# Altium schematic sheet 07 - MCU.SchDoc
size A3; SheetNumber: 5; SheetTotal: 7
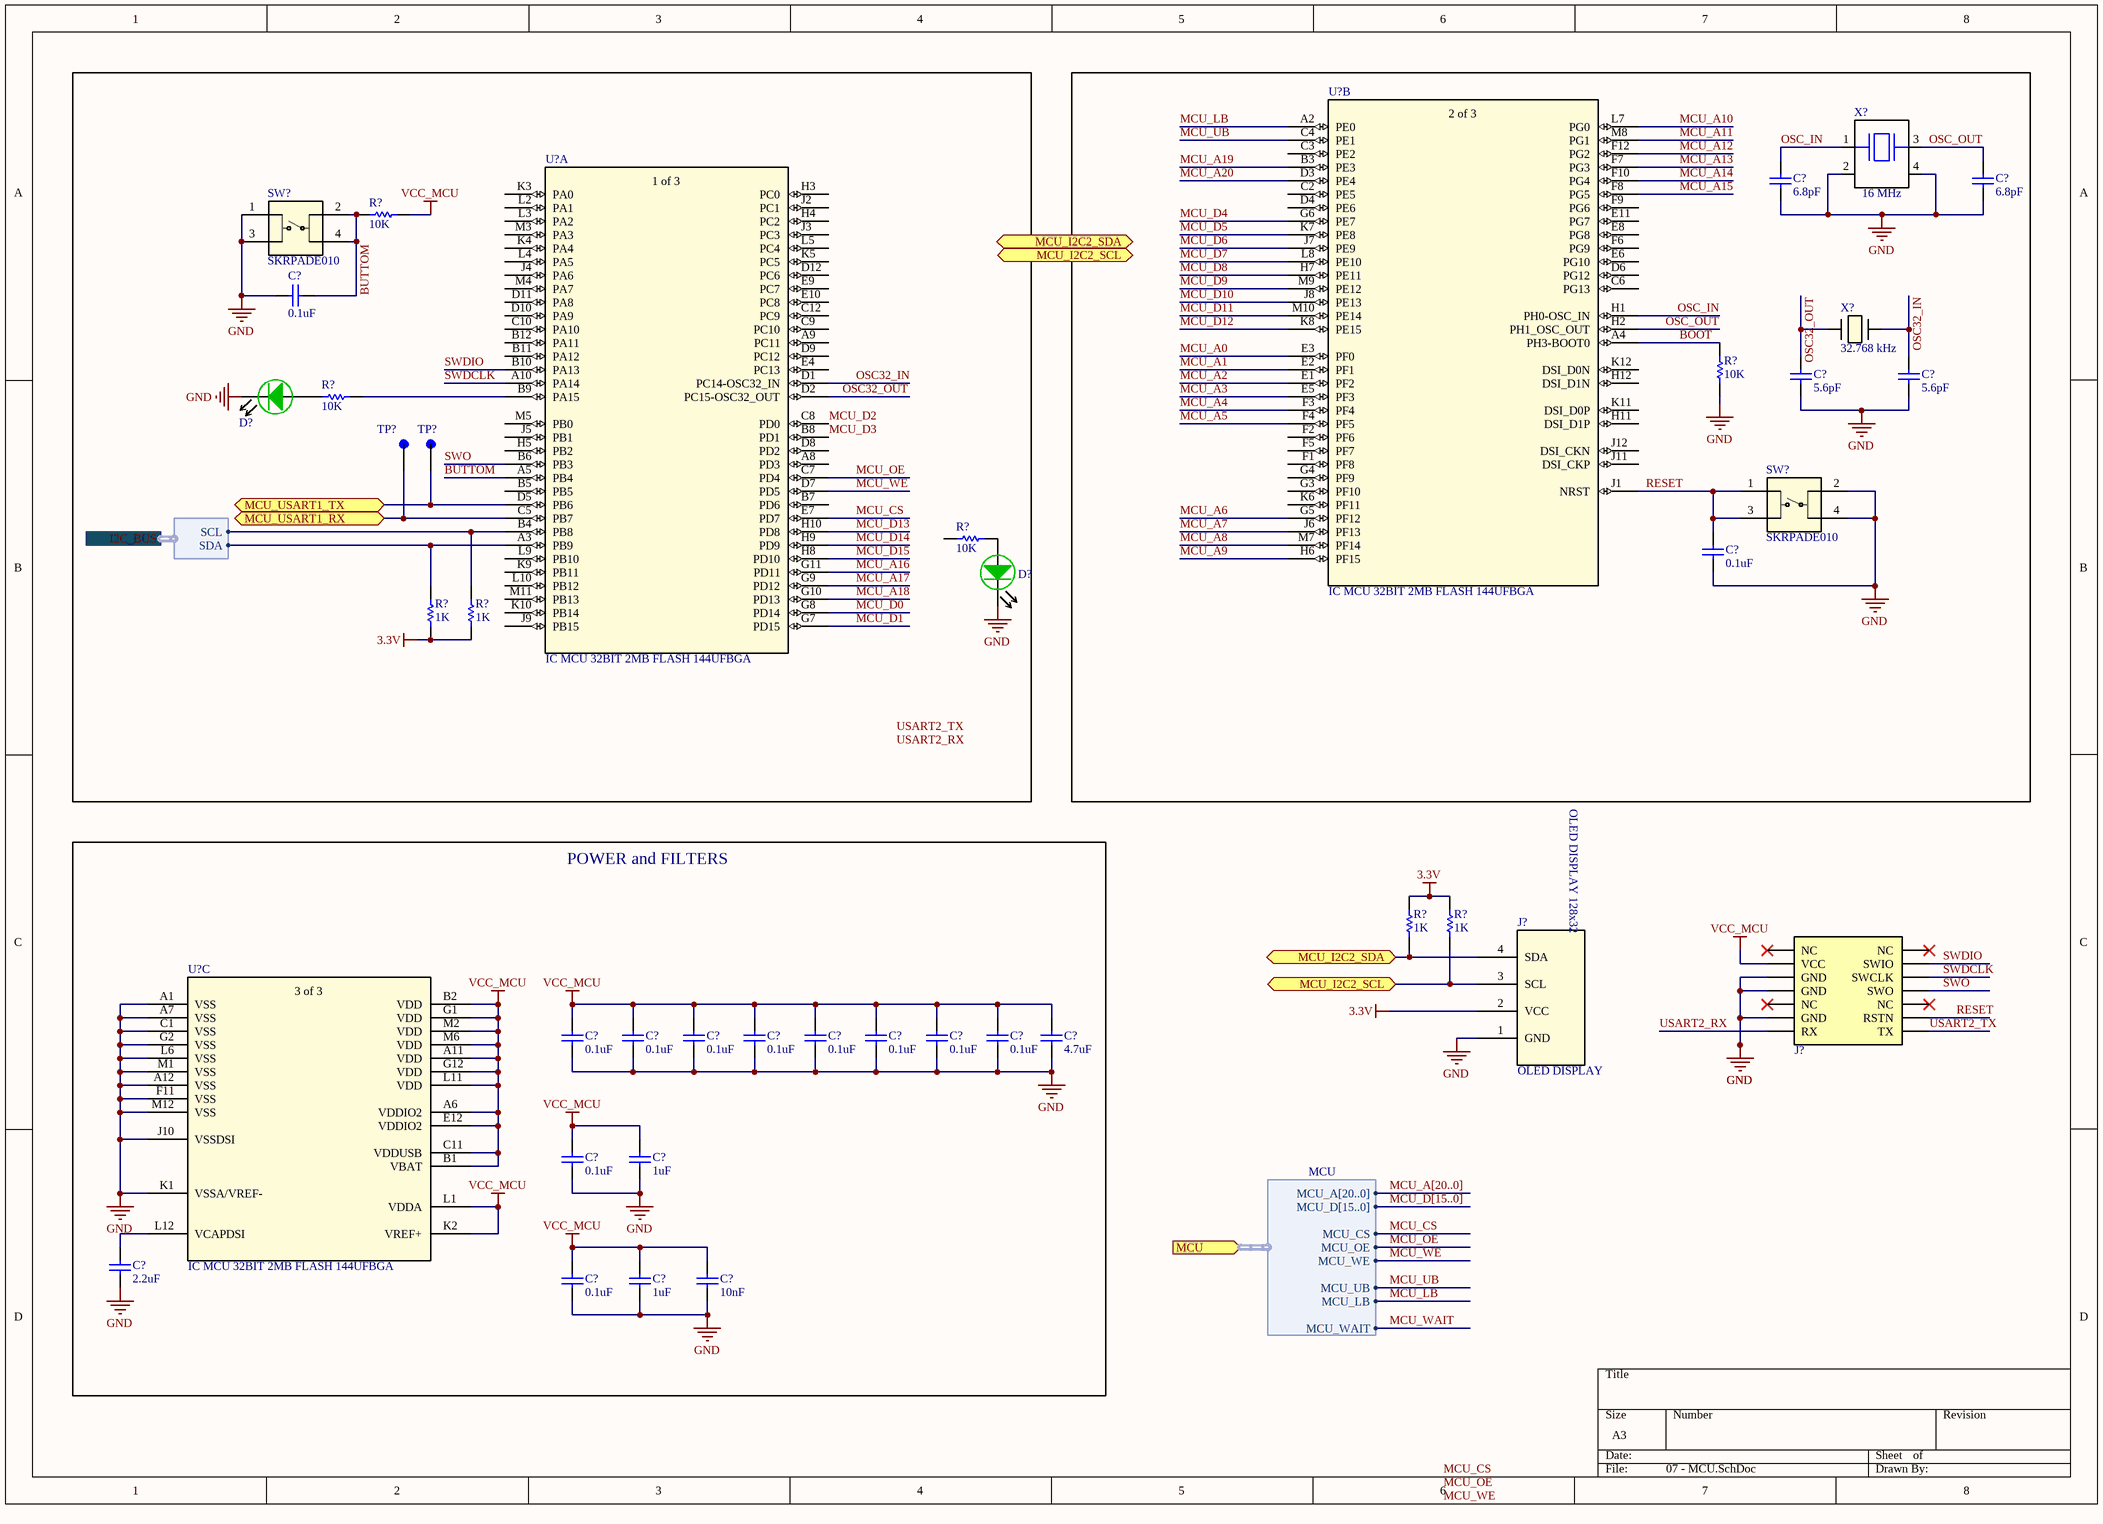
[diagram p0: 07 - MCU.SchDoc]

## Parts
(Parts that share a designator on the sheet are numbered #1, #2 ... from top to bottom, then left to right.)
C?#1  value 6.8pF  [0402-C-R]  (hidden comment: GRM0225C1E6R8CA03L)
C?#2  value 6.8pF  [0402-C-R]  (hidden comment: GRM0225C1E6R8CA03L)
C?#3  value 0.1uF  [0402-C-R]  (hidden comment: GRM155R61E104KA87D)
C?#4  value 5.6pF  [0402-C-R]  (hidden comment: CC0402BRNPO9BN5R6)
C?#5  value 5.6pF  [0402-C-R]  (hidden comment: CC0402BRNPO9BN5R6)
C?#6  value 0.1uF  [0402-C-R]  (hidden comment: GRM155R61E104KA87D)
C?#7  value 0.1uF  [0402-C-R]  (hidden comment: GRM155R61E104KA87D)
C?#8  value 0.1uF  [0402-C-R]  (hidden comment: GRM155R61E104KA87D)
C?#9  value 0.1uF  [0402-C-R]  (hidden comment: GRM155R61E104KA87D)
C?#10  value 0.1uF  [0402-C-R]  (hidden comment: GRM155R61E104KA87D)
C?#11  value 0.1uF  [0402-C-R]  (hidden comment: GRM155R61E104KA87D)
C?#12  value 0.1uF  [0402-C-R]  (hidden comment: GRM155R61E104KA87D)
C?#13  value 0.1uF  [0402-C-R]  (hidden comment: GRM155R61E104KA87D)
C?#14  value 0.1uF  [0402-C-R]  (hidden comment: GRM155R61E104KA87D)
C?#15  value 4.7uF  [0402-C-R]  (hidden comment: GRM155D81C475ME15J)
C?#16  value 0.1uF  [0402-C-R]  (hidden comment: GRM155R61E104KA87D)
C?#17  value 1uF  [0402-C-R]  (hidden comment: JMK105BJ105KV-F)
C?#18  value 2.2uF  [0402-C-R]  (hidden comment: 885012105013)
C?#19  value 0.1uF  [0402-C-R]  (hidden comment: GRM155R61E104KA87D)
C?#20  value 1uF  [0402-C-R]  (hidden comment: JMK105BJ105KV-F)
C?#21  value 10nF  [0402-C-R]  (hidden comment: KGM05AR71E103KH)
D?#1  150060GS75000  [LED0603]  (value not drawn)
D?#2  150060GS75000  [LED0603]  (value not drawn)
J?#1  CONN HEADER SMD 14POS 1.27MM_1  [SAMTEC_FTSH-107-01-L-DV-K-A]  (value not drawn)
J?#2  OLED DISPLAY  [OLED_DISPLAY]
R?#1  value 10K  [0402-R-R]  (hidden comment: RC0402FR-07560RL)
R?#2  value 10K  [0402-R-R]  (hidden comment: RC0402FR-07560RL)
R?#3  value 10K  [0402-R-R]  (hidden comment: RC0402FR-0710KL)
R?#4  value 10K  [0402-R-R]  (hidden comment: RC0402FR-0710KL)
R?#5  value 1K  [0402-R-R]  (hidden comment: RC0402FR-071KL)
R?#6  value 1K  [0402-R-R]  (hidden comment: RC0402FR-071KL)
R?#7  value 1K  [0402-R-R]  (hidden comment: RC0402FR-071KL)
R?#8  value 1K  [0402-R-R]  (hidden comment: RC0402FR-071KL)
SW?#1  SKRPADE010  [SKRPADE010_AAL]
SW?#2  SKRPADE010  [SKRPADE010_AAL]
TP?#1  5001  [TEST_POINT]  (value not drawn)
TP?#2  5001  [TEST_POINT]  (value not drawn)
U?#1  IC MCU 32BIT 2MB FLASH 144UFBGA  [UFBGA144-10x10mm]  (part B of 3)
U?#2  IC MCU 32BIT 2MB FLASH 144UFBGA  [UFBGA144-10x10mm]  (part A of 3)
U?#3  IC MCU 32BIT 2MB FLASH 144UFBGA  [UFBGA144-10x10mm]  (part C of 3)
X?#1  value 16 MHz  [XTAL_ECS-160-8-33Q-JES-TR]  (hidden comment: STDCRG1-16M)
X?#2  value 32.768 kHz  [XTAL_NX3215SA_NDK-M - duplicate]  (hidden comment: STDMUA14-32.768K)

## Blocks framed on the sheet
POWER and FILTERS: C?#7-C?#21 U?#3

## Ports
I2C_BUS (harness I2C), MCU (in, harness MCU), MCU_I2C2_SCL (bidir), MCU_I2C2_SDA (bidir), MCU_USART1_RX (bidir), MCU_USART1_TX (bidir)

## Harnesses
I2C: SCL, SDA
MCU: MCU_A[20..0], MCU_D[15..0], MCU_OE, MCU_WE, MCU_CS, MCU_UB, MCU_LB, MCU_WAIT

## Nets
3.3V: J?#2.2(VCC) R?#5.2 R?#6.2 R?#7.2 R?#8.2
GND: C?#1.2 C?#2.1 C?#3.2 C?#4.2 C?#5.2 C?#6.1 C?#7.1 C?#8.1 C?#9.1 C?#10.1 C?#11.1 C?#12.1 C?#13.1 C?#14.1 C?#15.1 C?#16.1 C?#17.1 C?#18.1 C?#19.1 C?#20.1 C?#21.1 D?#1.1(K) D?#2.1(K) J?#1.05(GND) J?#1.07(GND) J?#1.11(GND) J?#2.1(GND) R?#3.1 SW?#1.1 SW?#1.3 SW?#2.2 SW?#2.4 U?#3.A1(VSS) U?#3.A7(VSS) U?#3.A12(VSS) U?#3.C1(VSS) U?#3.F11(VSS) U?#3.G2(VSS) U?#3.J10(VSSDSI) U?#3.K1(VSSA/VREF-) U?#3.L6(VSS) U?#3.M1(VSS) U?#3.M12(VSS) X?#1.2(GND) X?#1.4(GND)
VCC_MCU: C?#7.2 C?#8.2 C?#9.2 C?#10.2 C?#11.2 C?#12.2 C?#13.2 C?#14.2 C?#15.2 C?#16.2 C?#17.2 C?#19.2 C?#20.2 C?#21.2 J?#1.03(VCC) R?#1.1 U?#3.A6(VDDIO2) U?#3.A11(VDD) U?#3.B1(VBAT) U?#3.B2(VDD) U?#3.C11(VDDUSB) U?#3.E12(VDDIO2) U?#3.G1(VDD) U?#3.G12(VDD) U?#3.K2(VREF+) U?#3.L1(VDDA) U?#3.L11(VDD) U?#3.M2(VDD) U?#3.M6(VDD)
BOOT: R?#3.2 U?#1.A4(PH3-BOOT0)
BUTTOM: C?#3.1 R?#1.2 SW?#1.2 SW?#1.4 U?#2.A5(PB4)
MCU_A0: U?#1.E3(PF0)
MCU_A1: U?#1.E2(PF1)
MCU_A2: U?#1.E1(PF2)
MCU_A3: U?#1.E5(PF3)
MCU_A4: U?#1.F3(PF4)
MCU_A5: U?#1.F4(PF5)
MCU_A6: U?#1.G5(PF12)
MCU_A7: U?#1.J6(PF13)
MCU_A8: U?#1.M7(PF14)
MCU_A9: U?#1.H6(PF15)
MCU_A10: U?#1.L7(PG0)
MCU_A11: U?#1.M8(PG1)
MCU_A12: U?#1.F12(PG2)
MCU_A13: U?#1.F7(PG3)
MCU_A14: U?#1.F10(PG4)
MCU_A15: U?#1.F8(PG5)
MCU_A16: U?#2.G11(PD11)
MCU_A17: U?#2.G9(PD12)
MCU_A18: U?#2.G10(PD13)
MCU_A19: U?#1.B3(PE3)
MCU_A20: U?#1.D3(PE4)
MCU_CS: U?#2.E7(PD7) ; port MCU.MCU_CS
MCU_D0: U?#2.G8(PD14)
MCU_D1: U?#2.G7(PD15)
MCU_D2: U?#2.C8(PD0)
MCU_D3: U?#2.B8(PD1)
MCU_D4: U?#1.G6(PE7)
MCU_D5: U?#1.K7(PE8)
MCU_D6: U?#1.J7(PE9)
MCU_D7: U?#1.L8(PE10)
MCU_D8: U?#1.H7(PE11)
MCU_D9: U?#1.M9(PE12)
MCU_D10: U?#1.J8(PE13)
MCU_D11: U?#1.M10(PE14)
MCU_D12: U?#1.K8(PE15)
MCU_D13: U?#2.H10(PD8)
MCU_D14: U?#2.H9(PD9)
MCU_D15: U?#2.H8(PD10)
MCU_I2C2_SCL: J?#2.3(SCL) R?#8.1 ; port MCU_I2C2_SCL
MCU_I2C2_SDA: J?#2.4(SDA) R?#7.1 ; port MCU_I2C2_SDA
MCU_LB: U?#1.A2(PE0) ; port MCU.MCU_LB
MCU_OE: U?#2.C7(PD4) ; port MCU.MCU_OE
MCU_UB: U?#1.C4(PE1) ; port MCU.MCU_UB
MCU_USART1_RX: TP?#1.1 U?#2.C5(PB7) ; port MCU_USART1_RX
MCU_USART1_TX: TP?#2.1 U?#2.D5(PB6) ; port MCU_USART1_TX
MCU_WAIT: port MCU.MCU_WAIT
MCU_WE: U?#2.D7(PD5) ; port MCU.MCU_WE
OSC32_IN: C?#5.1 U?#2.D1(PC14-OSC32_IN) X?#2.2
OSC32_OUT: C?#4.1 U?#2.D2(PC15-OSC32_OUT) X?#2.1
OSC_IN: C?#2.2 U?#1.H1(PH0-OSC_IN) X?#1.1
OSC_OUT: C?#1.1 U?#1.H2(PH1_OSC_OUT) X?#1.3
RESET: C?#6.2 J?#1.12(RSTN) SW?#2.1 SW?#2.3 U?#1.J1(NRST)
SWDCLK: J?#1.06(SWCLK) U?#2.A10(PA14)
SWDIO: J?#1.04(SWIO) U?#2.B10(PA13)
SWO: J?#1.08(SWO) U?#2.B6(PB3)
USART2_RX: J?#1.13(RX)
USART2_TX: J?#1.14(TX)
NetC?#18_2: C?#18.2 U?#3.L12(VCAPDSI)
NetD?#1_2: D?#1.2(A) R?#2.2
NetD?#2_2: D?#2.2(A) R?#4.1
NetR?#2_1: R?#2.1 U?#2.B9(PA15)
NetR?#5_1: R?#5.1 U?#2.A3(PB9) ; port I2C_BUS.SDA
NetR?#6_1: R?#6.1 U?#2.B4(PB8) ; port I2C_BUS.SCL

Not connected (* = marked no-connect by the designer): J?#1 01(NC)* 02(NC)* 09(NC)* 10(NC)*; R?#4 2; U?#1 C2(PE5) C3(PE2) C6(PG13) D4(PE6) D6(PG12) E6(PG10) E8(PG8) E11(PG7) F1(PF8) F2(PF6) F5(PF7) F6(PG9) F9(PG6) G3(PF10) G4(PF9) H11(DSI_D1P) H12(DSI_D1N) J11(DSI_CKP) J12(DSI_CKN) K6(PF11) K11(DSI_D0P) K12(DSI_D0N); U?#2 A8(PD3) A9(PC11) B5(PB5) B7(PD6) B11(PA12) B12(PA11) C9(PC10) C10(PA10) C12(PC9) D8(PD2) D9(PC12) D10(PA9) D11(PA8) D12(PC6) E4(PC13) E9(PC7) E10(PC8) H3(PC0) H4(PC2) H5(PB2) J2(PC1) J3(PC3) J4(PA6) J5(PB1) J9(PB15) K3(PA0) K4(PA4) K5(PC5) K9(PB11) K10(PB14) L2(PA1) L3(PA2) L4(PA5) L5(PC4) L9(PB10) L10(PB12) M3(PA3) M4(PA7) M5(PB0) M11(PB13)

## Buses and harness runs
bus MCU_A[20..0]
bus MCU_D[15..0]

## Notes on the sheet
- Labels drawn without touching a wire or pin: MCU_CS, MCU_OE, MCU_WE, USART2_RX, USART2_TX
- (in symbol IC MCU 32BIT 2MB FLASH 144UFBGA, part A) 1 of 3
- (in symbol IC MCU 32BIT 2MB FLASH 144UFBGA, part B) 2 of 3
- (in symbol IC MCU 32BIT 2MB FLASH 144UFBGA, part C) 3 of 3
- (in symbol OLED DISPLAY) OLED DISPLAY 128x32

## Library data of the parts
C?#1 C?#2 = CAP CER 6.8PF 25V C0G/NP0 01005: 6.8 pF ±0.25pF 25V Ceramic Capacitor C0G, NP0 01005 (0402 Metric); TOLERANCE: 5%; SIZE: 0402; VOLTAGE: 25V; PN: GRM0225C1E6R8CA03L
C?#3 C?#6-C?#14 C?#16 C?#19 = CAP CER 0.1UF 25V X5R 0402: 0.1 µF ±10% 25V Ceramic Capacitor X5R 0402 (1005 Metric); SIZE: 0402; PN: GRM155R61E104KA87D; VOLTAGE: 25V; TOLERANCE: 10%
C?#4 C?#5 = CAP CER 5.6PF 50V C0G/NPO 0402: 5.6 pF ±0.1pF 50V Ceramic Capacitor C0G, NP0 0402 (1005 Metric); TOLERANCE: 1%; SIZE: 0402; VOLTAGE: 50V; PN: CC0402BRNPO9BN5R6
C?#15 = CAP CER 4.7UF 25V X5R 0402: CAP SMD 0402 MLCC GERAL 4.7uF 25V ±20% 0402 X5s PN: GRM155D81C475ME15J MURATA; SIZE: 0402; VOLTAGE: 25V; TOLERANCE: 20%; PN: GRM155D81C475ME15J
C?#17 C?#20 = CAP CER 1UF 6.3V X5R 0402: 1 µF ±10% 6.3V Ceramic Capacitor X5R 0402 (1005 Metric); SIZE: 0402; VOLTAGE: 6.3V; TOLERANCE: 10%; PN: JMK105BJ105KV-F
C?#18 = CAP CER 2.2UF 10V X5R 0402: 2.2 µF ±20% 10V Ceramic Capacitor X5R 0402 (1005 Metric); SIZE: 0402; VOLTAGE: 10V; TOLERANCE: 20%; PN: 885012105013
C?#21 = CAP CER 10nF 25V X7R 0402: 10000 pF ±10% 25V Ceramic Capacitor X7R 0402 (1005 Metric); SIZE: 0402; VOLTAGE: 25V; TOLERANCE: 10%; PN: KGM05AR71E103KH
D?#1 D?#2 = LED SMD VD 0603: LED SMD VD ALTO BRILHO 1,6x0,8x0,8mm 430mcd PN:150060GS75000 0603 WURTH; ID: ?; PN: 150060GS75000
J?#1 = CONN HEADER SMD 14POS 1.27MM_1: CONN HEADER SMD 14POS 1.27MM PN: FTSH-107-01-L-DV-K-A; MF: Samtec Inc.; Package: None; Value: *; Price: None; PN: FTSH-107-01-L-DV-K-A; SnapEDA_Link: https://www.snapeda.com/parts/FTSH-107-01-L-DV-K-A/Samtec%20Inc./view-part/2791957/?ref=snap; Availability: Bad
R?#1 R?#2 = RES 10K OHM 1% 1/16W 0402: 10 kOhms ±1% 0,063W, 1/16W Resistor de chip 0402 (métrico 1005) Resistente à umidade Filme grosso; PACK: 0402; POWER: 0.063W; PN: RC0402FR-0710KL; TOLERANCE: 1%
R?#3 R?#4 = RES 10K OHM 1% 1/16W 0402: 10 kOhms ±1% 0,063W, 1/16W Resistor de chip 0402 (métrico 1005) Resistente à umidade Filme grosso; PACK: 0402; POWER: 0.063W; TOLERANCE: 1%; PN: RC0402FR-0710KL
R?#5-R?#8 = RES 1K OHM 1% 1/16W 0402: 1 kOhms ±1% 0.063W, 1/16W Chip Resistor 0402 (1005 Metric) Moisture Resistant Thick Film; PACK: 0402; POWER: 0.063W; TOLERANCE: 1%; PN: RC0402FR-071KL
SW?#1 SW?#2 = SWITCH TACTILE SPST-NO 0.05A 16V: Interruptor tátil SPST-NA Top atuado Montagem em superfície; Mfr_Name: Alps Electric; RefDes: RefDes; Type: Type; PN: SKRPADE010
TP?#1 TP?#2 = PC TEST POINT MINIATURE BLACK: PC TEST POINT MINIATURE BLACK PN: 5001; MF: Keystone Electronics Corp.; SnapEDA_Link: https://www.snapeda.com/parts/5001/Keystone+Electronics/view-part/?ref=snap; Package: None; Value: *; PN: 5001; Check_prices: https://www.snapeda.com/parts/5001/Keystone+Electronics/view-part/?ref=eda
U?#1-U?#3 = IC MCU 32BIT 2MB FLASH 144UFBGA: ARM® Cortex®-M4 STM32L4 Microcontroller IC 32-Bit Single-Core 120MHz 2MB (2M x 8) FLASH 144-UFBGA (10x10) PN: STM32L4R9ZIJ6; Mfr_Name: STMicroelectronics; RefDes: RefDes; Type: Type; PN: STM32L4R9ZIJ6
X?#1 = CRYSTAL 16.0000MHZ 8PF SMD: 16 MHz ±20ppm Crystal 8pF 80 Ohms 4-SMD, No Lead; SnapEDA_Link: https://www.snapeda.com/parts/ECS-160-8-33Q-JES-TR/ECS/view-part/?ref=snap; Package: ECX-33Q-33Q-4 ECS; PN: STDCRG1-16M
X?#2 = CRYSTAL 32.7680KHZ 6PF SMD: 32.768 kHz ±20ppm Crystal 6pF 70 kOhms 2-SMD, No Lead; Mfr_Name: NDK; Type: Crystals; PN: STDMUA14-32.768K